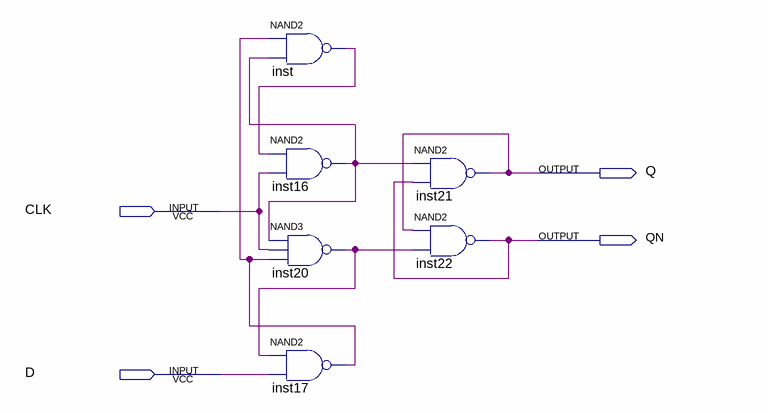
[diagram p0: schematic sheet]
// Quartus schematic lab9step3b.bdf as structural Verilog: 6 symbols, 4 pins
module lab9step3b (
  input  CLK,
  input  D,
  output Q,
  output QN
);

  wire inst16_out, inst17_out, inst20_out, inst_out;

  nand inst (inst_out, inst17_out, inst16_out);
  nand inst16 (inst16_out, inst_out, CLK);
  nand inst20 (inst20_out, inst16_out, CLK, inst17_out);
  nand inst17 (inst17_out, inst20_out, D);
  nand inst21 (Q, inst16_out, QN);
  nand inst22 (QN, Q, inst20_out);
endmodule
